# Altium schematic sheet rfr27_group12project_schematic.SchDoc
size A4; SheetNumber: 1; SheetTotal: 1; SPICEModelCacheGZZWMBCH: <root> / <DocumentId>GZZWMBCH</DocumentId> / <CacheFrame Number="0"> / <Model Name="2n7000" Kind="CKT"> / <Text>.SUBCKT 2n7000 1 2 3 / ************************************** / *      Model Generated by MODPEX     * / *Copyright(c) Symmetry Design Systems* / *         All Rights Reserved        * / *    UNPUBLISHED LICENSED SOFTWARE   * / *   Contains Proprietary Information * / *      Which is The Property of      * / *     SYMMETRY OR ITS LICENSORS      * / *Commercial Use or Resale Restricted * / *   by Symmetry License Agreement    * / ************************************** / * Model generated on Mar 31, 04 / * MODEL FORMAT: PSpice / * Symmetry POWER MOS Model (Version 1.0) / * External Node Designations / * Node 1 -&gt; Drain / * Node 2 -&gt; Gate / * Node 3 -&gt; Source / M1 9 7 8 8 MM L=100u W=100u / * Default values used in MM: / * The voltage-dependent capacitances are / * not included. Other default values are: / *   RS=0 RD=0 LD=0 CBD=0 CBS=0 CGBO=0 / .MODEL MM NMOS LEVEL=1 IS=1e-32 / +VTO=2.236 LAMBDA=0 KP=0.0932174 / +CGSO=1.79115e-07 CGDO=1.0724e-11 / RS 8 3 1.10523 / D1 3 1 MD / .MODEL MD D IS=2.71011e-10 RS=0.0140826 N=1.5 BV=60 / +IBV=1e-05 EG=1.16084 XTI=3.00131 TT=0 / +CJO=3.41211e-11 VJ=4.67429 M=0.899864 FC=0.1 / RDS 3 1 2.4e+11 / RD 9 1 0.0001 / RG 2 7 2.18034 / D2 4 5 MD1 / * Default values used in MD1: / *   RS=0 EG=1.11 XTI=3.0 TT=0 / *   BV=infinite IBV=1mA / .MODEL MD1 D IS=1e-32 N=50 / +CJO=7.93181e-11 VJ=0.643298 M=0.9 FC=1e-08 / D3 0 5 MD2 / * Default values used in MD2: / *   EG=1.11 XTI=3.0 TT=0 CJO=0 / *   BV=infinite IBV=1mA / .MODEL MD2 D IS=1e-10 N=0.400165 RS=3.00002e-06 / RL 5 10 1 / FI2 7 9 VFI2 -1 / VFI2 4 0 0 / EV16 10 0 9 7 1 / CAP 11 10 1.58786e-10 / FI1 7 9 VFI1 -1 / VFI1 11 6 0 / RCAP 6 10 1 / D4 0 6 MD3 / * Default values used in MD3: / *   EG=1.11 XTI=3.0 TT=0 CJO=0 / *   RS=0 BV=infinite IBV=1mA / .MODEL MD3 D IS=1e-10 N=0.400165 / .ENDS 2n7000</Text> / </Model> / </CacheFrame> / </root>
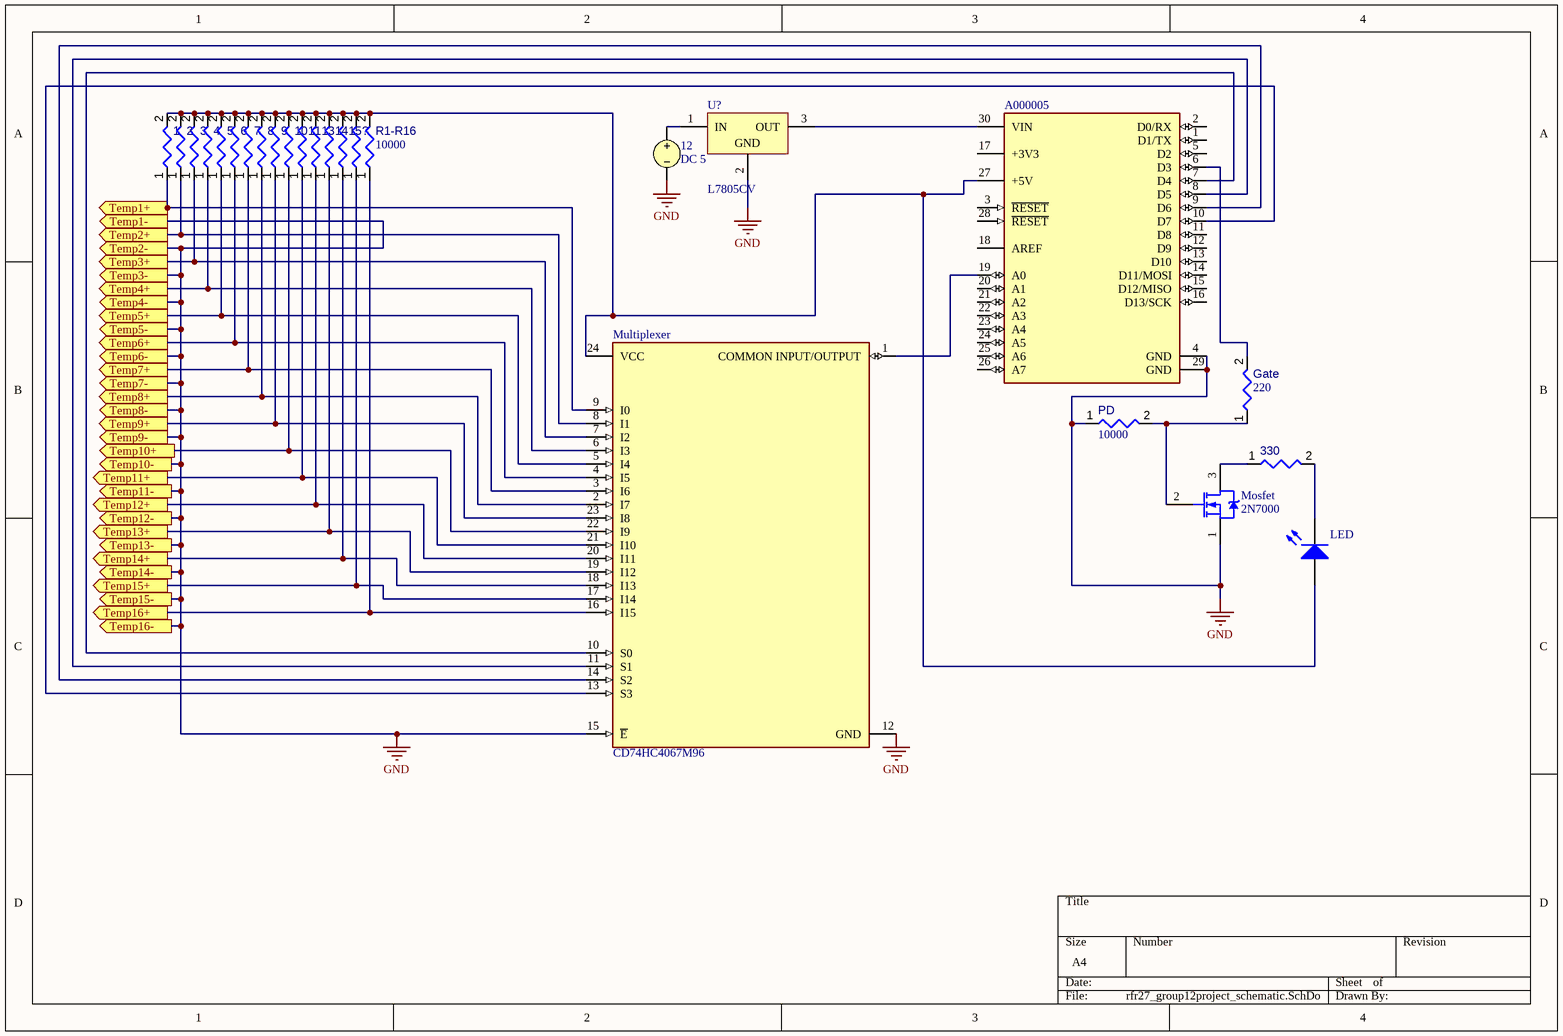
[diagram p0: rfr27_group12project_schematic.SchDoc]

## Parts
1  Resistor 10R  +/-1 % 0402 63 mW  [RESC0402(1005)_L]  (value not drawn)
2  Resistor 10R  +/-1 % 0402 63 mW  [RESC0402(1005)_L]  (value not drawn)
3  Resistor 10R  +/-1 % 0402 63 mW  [RESC0402(1005)_L]  (value not drawn)
4  Resistor 10R  +/-1 % 0402 63 mW  [RESC0402(1005)_L]  (value not drawn)
5  Resistor 10R  +/-1 % 0402 63 mW  [RESC0402(1005)_L]  (value not drawn)
6  Resistor 10R  +/-1 % 0402 63 mW  [RESC0402(1005)_L]  (value not drawn)
7  Resistor 10R  +/-1 % 0402 63 mW  [RESC0402(1005)_L]  (value not drawn)
8  Resistor 10R  +/-1 % 0402 63 mW  [RESC0402(1005)_L]  (value not drawn)
9  Resistor 10R  +/-1 % 0402 63 mW  [RESC0402(1005)_L]  (value not drawn)
10  Resistor 10R  +/-1 % 0402 63 mW  [RESC0402(1005)_L]  (value not drawn)
11  Resistor 10R  +/-1 % 0402 63 mW  [RESC0402(1005)_L]  (value not drawn)
12  DC 5
13  Resistor 10R  +/-1 % 0402 63 mW  [RESC0402(1005)_L]  (value not drawn)
14  Resistor 10R  +/-1 % 0402 63 mW  [RESC0402(1005)_L]  (value not drawn)
15  Resistor 10R  +/-1 % 0402 63 mW  [RESC0402(1005)_L]  (value not drawn)
330  Resistor 10k +/-1% 0805 125 mW  [RESC2013X50X35ML15T15]  (value not drawn)
?  Resistor 10R  +/-1 % 0402 63 mW  [RESC0402(1005)_L]  (value not drawn)
A000005  (no value)  [FP-A000005-MFG]
Gate  value 220  [RESC2013X50X35ML15T15]  (hidden comment: Resistor 10k +/-1% 0805 125 mW)
LED  Light-Emitting Diode  (value not drawn)
Mosfet  2N7000  [ONSC-TO-92-3-29-11]
Multiplexer  CD74HC4067M96  [FP-DW0024A-MFG]
PD  value 10000  [RESC0402(1005)_L]  (hidden comment: Resistor 10R  +/-1 % 0402 63 mW)
R1-R16  value 10000  [RESC0402(1005)_L]  (hidden comment: Resistor 10R  +/-1 % 0402 63 mW)
U?  L7805CV  [TO220]

## Ports
Temp1+ (out), Temp1- (out), Temp2+ (out), Temp2- (out), Temp3+ (out), Temp3- (out), Temp4+ (out), Temp4- (out), Temp5+ (out), Temp5- (out), Temp6+ (out), Temp6- (out), Temp7+ (out), Temp7- (out), Temp8+ (out), Temp8- (out), Temp9+ (out), Temp9- (out), Temp10+ (out), Temp10- (out), Temp11+ (out), Temp11- (out), Temp12+ (out), Temp12- (out), Temp13+ (out), Temp13- (out), Temp14+ (out), Temp14- (out), Temp15+ (out), Temp15- (out), Temp16+ (out), Temp16- (out)

## Nets
GND: 12.2 A000005.4(GND) A000005.29(GND) Mosfet.1(S) Multiplexer.12(GND) Multiplexer.15(~{E}) PD.1 U?.2(GND) ; port Temp1-, port Temp2-, port Temp3-, port Temp8-, port Temp7-, port Temp5-, port Temp6-, port Temp4-, port Temp9-, port Temp10-, port Temp11-, port Temp16-, port Temp15-, port Temp13-, port Temp14-, port Temp12-
Temp1+: 1.1 Multiplexer.9(I0) ; port Temp1+
Temp2+: 2.1 Multiplexer.8(I1) ; port Temp2+
Temp3+: 3.1 Multiplexer.7(I2) ; port Temp3+
Temp4+: 4.1 Multiplexer.6(I3) ; port Temp4+
Temp5+: 5.1 Multiplexer.5(I4) ; port Temp5+
Temp6+: 6.1 Multiplexer.4(I5) ; port Temp6+
Temp7+: 7.1 Multiplexer.3(I6) ; port Temp7+
Temp8+: 8.1 Multiplexer.2(I7) ; port Temp8+
Temp9+: 9.1 Multiplexer.23(I8) ; port Temp9+
Temp10+: 10.1 Multiplexer.22(I9) ; port Temp10+
Temp11+: 11.1 Multiplexer.21(I10) ; port Temp11+
Temp12+: 13.1 Multiplexer.20(I11) ; port Temp12+
Temp13+: 14.1 Multiplexer.19(I12) ; port Temp13+
Temp14+: 15.1 Multiplexer.18(I13) ; port Temp14+
Temp15+: ?.1 Multiplexer.17(I14) ; port Temp15+
Temp16+: Multiplexer.16(I15) R1-R16.1 ; port Temp16+
Net1_2: 1.2 2.2 3.2 4.2 5.2 6.2 7.2 8.2 9.2 10.2 11.2 13.2 14.2 15.2 ?.2 A000005.27(+5V) LED.1(A) Multiplexer.24(VCC) R1-R16.2
Net12_1: 12.1 U?.1(IN)
Net330_1: 330.1 Mosfet.3(D)
Net330_2: 330.2 LED.2(K)
NetA000005_6: A000005.6(D3) Gate.2
NetA000005_7: A000005.7(D4) Multiplexer.10(S0)
NetA000005_8: A000005.8(D5) Multiplexer.11(S1)
NetA000005_9: A000005.9(D6) Multiplexer.14(S2)
NetA000005_10: A000005.10(D7) Multiplexer.13(S3)
NetA000005_19: A000005.19(A0) Multiplexer.1(COMMON_INPUT/OUTPUT)
NetA000005_30: A000005.30(VIN) U?.3(OUT)
NetGate_1: Gate.1 Mosfet.2(G) PD.2

Not connected (* = marked no-connect by the designer): A000005 1(D1/TX) 2(D0/RX) 3(~{RESET}) 5(D2) 11(D8) 12(D9) 13(D10) 14(D11/MOSI) 15(D12/MISO) 16(D13/SCK) 17(+3V3) 18(AREF) 20(A1) 21(A2) 22(A3) 23(A4) 24(A5) 25(A6) 26(A7) 28(~{RESET})

## Library data of the parts
1-11 13-15 ? PD R1-R16 = CMP-009-00152-3: Chip Resistor, 10 Ohms, +/-1 %, 63 mW, -55 to 155 degC, 0402; Tolerance: 1%; Power: 63mW; Pins: 2; Max Operating Temperature: 155°C; Min Operating Temperature: -55°C; Case/Package: 0402
12 = VSRC: Voltage Source; Note: PCB Footprint - Not required; AC Magnitude: 1; AC Phase: 0; Value: 5; Published: 8-Jun-2000; LatestRevisionDate: 17-Jul-2002; LatestRevisionNote: Re-released for DXP Platform.; PackageReference: Not Applicable; Publisher: Altium Limited
330 Gate = CMP-009-00018-5: Chip Resistor, 10 KOhm, +/- 1%, 125 mW, -55 to 155 degC, 0805 (2012 Metric); Power: 125mW; Voltage Rating: 150V; Tolerance: 1%; Pins: 2; Min Operating Temperature: -55°C; Case/Package: 0805; Max Operating Temperature: 155°C; RoHS Compliant: True; Mounting Technology: SM
A000005 = CMP-189986-000002-1: ARDUINO NANO ATMEGA328 EVAL BRD; Number of Bits: 8; Evaluation Kit: Yes; Operating Supply Voltage: 12V; Interface: I2C; Data Bus Width: 8b; Core Architecture: AVR; Packaging: Bulk; Length: 7inch; Package Quantity: 50; Width: 5inch; REACH SVHC: No SVHC; Weight: 0.358383oz; Series: AVR® ATmega; Height: 0.25inch
LED = LED: AF: 1; BV: 0; BV_MAX: 1e99; EG: 1.11; FC: 0.5; IBV: 0.001; IS: 1e-14; MJSW: 0.33; NTUN: 30; TNOM: 27; XTI: 3; SimulationGenericComponent: True; CJO: 0; CJP: 0; CTA: 0; CTP: 0; FCS: 0.5; FV_MAX: 1e99; IKF: 0; IKR: 0; ISR: 1e-14; JSW: 0; JTUN: 0; JTUNSW: 0; KEG: 1; KF: 0; LEVEL: 1; N: 1; NBV: 1; NR: 1; NS: 1; PHP: 1; RS: 0; TCV: 0; TLEV: 0; TLEVC: 0; TM1: 0; TM2: 0; TPB: 0; TPHP: 0; TRS: 0; TRS2: 0; TT: 0; TTT1: 0; TTT2: 0; VJ: 1; XTITUN: 3
Mosfet = CMP-1058-00936-1: Small Signal MOSFET, 200 mA, 60 V, N-Channel, 3-Pin TO-92, Bulk Box; Manufacturer: On Semiconductor; Ciss Typ (pF): 60; VGS(th) Max (V): 3; Crss Typ (pF): 5; Channel Polarity: N Channel; VGS Max (V): 20; Configuration: Single; PD Max (W): 0.35; Coss Typ (pF): 25; ID Max (A): 0.2; PackageVersion: Rev. AM; ComponentLink3URL: http://www.onsemi.cn/pub_link/Collateral/2N6426-D.PDF; ComponentLink2URL: http://www.onsemi.com/pub_link/Collateral/2N7000-D.PDF; DatasheetVersion: Rev. 8; Mounting Technology: Through Hole; V(BR)DSS Min (V): 60; PartNumber: 2N7000; PackageDescription: 3-Pin Transistor Outline, Body 4.825 x 3.685 mm, Pitch 1.27 mm; ComponentLink2Description: Datasheet; ComponentLink1URL: http://www.onsemi.com/; PackageReference: TO-92-3-29-11_AM_SL; Packing: Bulk Box; ComponentLink1Description: Manufacturer URL; Package Type: TO-92; ComponentLink3Description: Package Specification
Multiplexer = CMP-04901-000007-1: IC MUX/DEMUX 1X16 24SOIC; Manufacturer: Texas Instruments; Standoff Height: 0.1mm; Logic Function Desc: Non-Inverting; Max Supply Voltage: 6V; Number Of Inputs: 16; Quiescent Current: 8uA; Number Of Circuits: 1; Propagation Delay: 6ns; Max Junction Temp: +150°C; Min Supply Voltage: 2V; ComponentLink2Description: Datasheet; Octopart: https://octopart.com/cd74hc4067m96-texas+instruments-722802; Ambient Temperature Range High: +125°C; Ipc Land Pattern Name: SOIC127P1030X265-24; Height: 2.65mm; Mouser Description: Multiplexer Switch ICs Hi-Spd CMOS 16Ch Anl Mltplxr/Demltplxr; Temperature Range Low: -55°C; Package: DW0024A; Temperature Range High: +125°C; Lead Free: Yes; ComponentLink2URL: http://www.ti.com/lit/ds/symlink/cd74hc4067.pdf; Manufacturer Part Number: CD74HC4067M96; RoHS: TRUE; Automotive: No; Device Class L1: Integrated Circuits (ICs); Digikey Description: IC MUX/DEMUX 1X16 24SOIC; Device Class L2: Logic ICs; Temperature: -55°C to +125°C; Device Class L3: Multiplexers; Category: IC; Ambient Temperature Range Low: -55°C; Number Of Outputs: 1
U? = CMP-019-00018-3: Positive Voltage Regulator IC, 1.5 A, 5 V, 0 to 125 degC, 3-Pin TO-220, RoHS, Tube; Manufacturer: STMicroelectronics; Max Input Voltage: 35V; Min Supply Voltage: 8V; Nominal Output Voltage: 5V; Outputs: 1; Output Current: 1.5A; Dropout Voltage: 2V; Max Supply Voltage: 20V; Min Input Voltage: 7V; Datasheet Version: Rev 30, 09/2012; Min Operating Temperature: 0°C; Manufacturer URL: http://www.st.com/; Pins: 3; Mounting Technology: TH; Output Voltage: 5V; RoHS Compliant: True; Max Ouput Current: 1.5A; Datasheet URL: https://datasheet.ciiva.com/15111/getdatasheetpartid-44136-15111027.pdf; Packaging: Rail/Tube; Max Operating Temperature: 125°C; Case/Package: TO-220; Package Quantity: 50